# Altium project BNC Adapter.PrjPcb
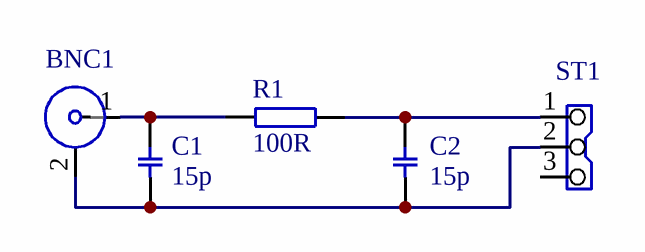
[diagram p0: BNC Adapter.SchDoc]
1 sheet, 5 parts. Net scope: global (net labels, ports and power ports of the same name join across sheets).
Board files: BNC Adapter.PcbDoc, BNC Adapter (Nutzen).PcbDoc

## Sheet BNC Adapter.SchDoc: BG BNC EMV Adapter V2
size A4; Organization: Analog Amplifier; Address1: D-96529 Meng.-Haemmern; Address2: Industriestrasse 8; Address3: (+49) 3675/42265-0; Address4: info@BEAK-electronic.de; DocumentNumber: 101.109; Revision: 0; SheetNumber: 1; SheetTotal: 1; Author: A. Arm

### Parts
BNC1  M BNC Buchse liegend PCB gefiltert  [M BNC 456E]  (value not drawn)
C1  15p  [C 1206]
C2  15p  [C 1206]
R1  100R  [R 1206]
ST1  M Stiftl B-3B-PH-K-S  [EDV 3481]  (value not drawn)

### Nets
NetBNC1_1: BNC1.1 C1.2 R1.1
NetBNC1_2: BNC1.2 C1.1 C2.1 ST1.2
NetC2_2: C2.2 R1.2 ST1.1

Not connected (* = marked no-connect by the designer): ST1 3

### Notes on the sheet
- Project:
- BEAK electronic engineering
- File:
- Title:
- Department:
- Engineering
- Author:
- EDV-Nr.:
- Sheet
- of

### Library data of the parts
BNC1 = M BNC Buchse liegend PCB gefiltert: 6780
C1 C2 = C 15pF/50V/NP0/1206: 3424
R1 = R 100R/5%/1206: 1545
ST1 = M Stiftl B-3B-PH-K-S: 3481